# Altium schematic sheet 04_NAVIGATION.SchDoc
size A4; SheetNumber: 4; SheetTotal: 7
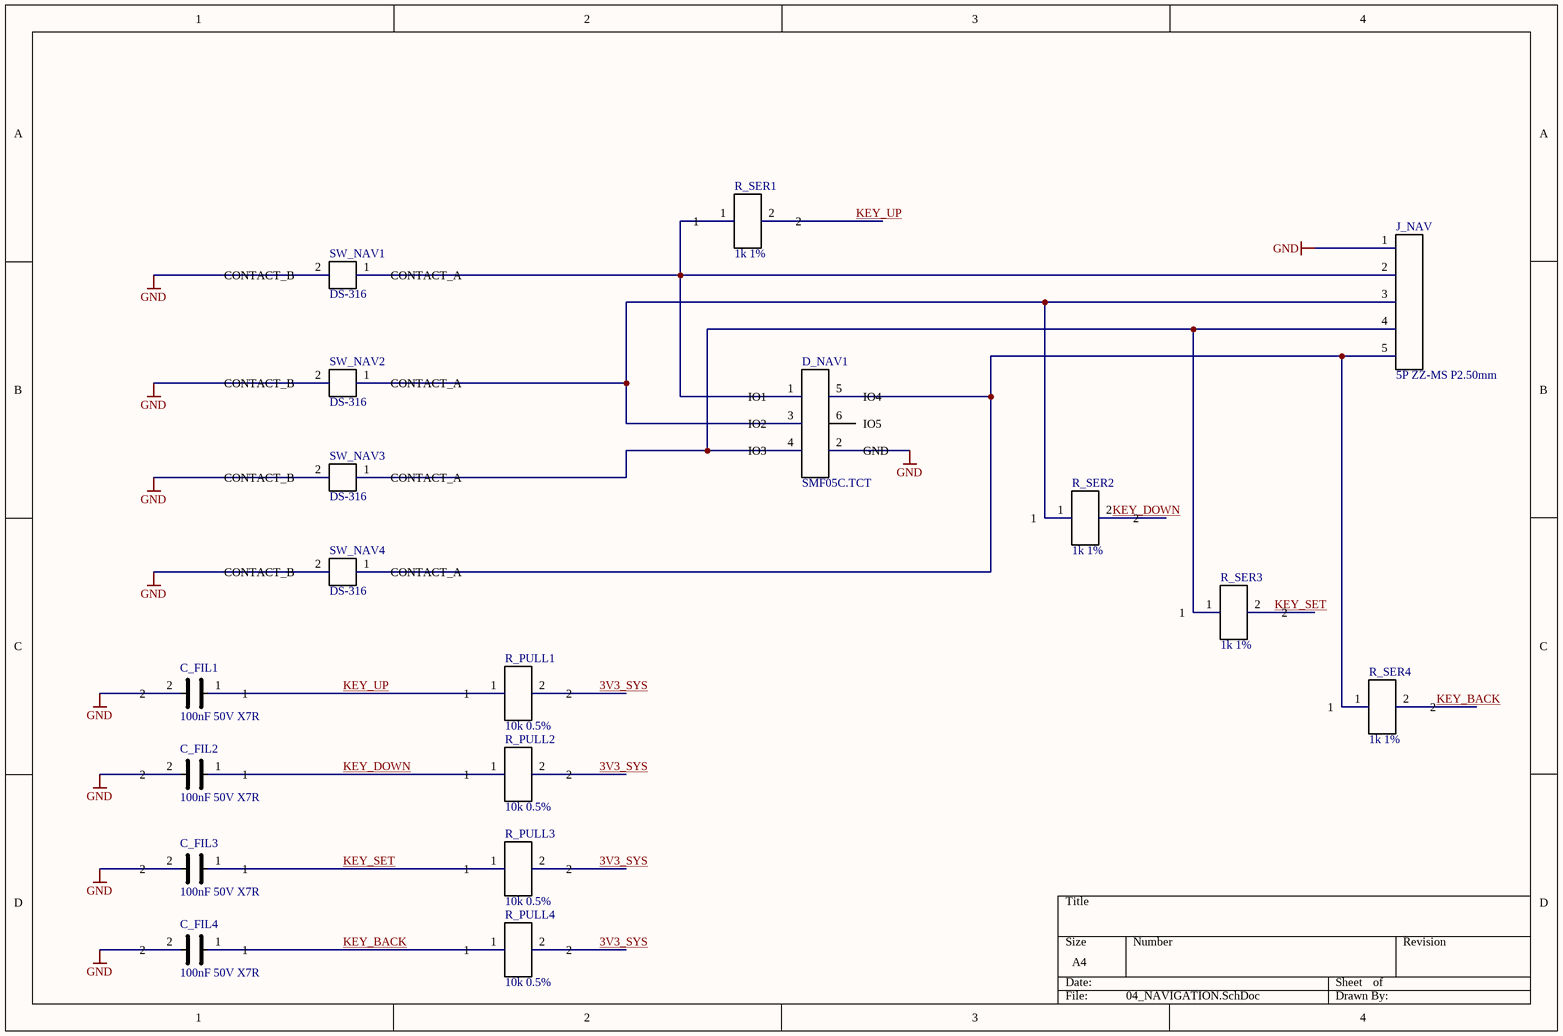
[diagram p0: 04_NAVIGATION.SchDoc]

## Parts
C_FIL1  100nF 50V X7R  [SAMSUNG_CL10_0603_CAP_2P]
C_FIL2  100nF 50V X7R  [SAMSUNG_CL10_0603_CAP_2P]
C_FIL3  100nF 50V X7R  [SAMSUNG_CL10_0603_CAP_2P]
C_FIL4  100nF 50V X7R  [SAMSUNG_CL10_0603_CAP_2P]
D_NAV1  SMF05C.TCT  [SEMTECH_SC70_6L_SMF05C]
J_NAV  5P ZZ-MS P2.50mm  [SHOUHAN_2P50_1X05_ZZMS_THT]
R_PULL1  10k 0.5%  [RES_0805_SHARED_2P]
R_PULL2  10k 0.5%  [RES_0805_SHARED_2P]
R_PULL3  10k 0.5%  [RES_0805_SHARED_2P]
R_PULL4  10k 0.5%  [RES_0805_SHARED_2P]
R_SER1  1k 1%  [RES_0805_SHARED_2P]
R_SER2  1k 1%  [RES_0805_SHARED_2P]
R_SER3  1k 1%  [RES_0805_SHARED_2P]
R_SER4  1k 1%  [RES_0805_SHARED_2P]
SW_NAV1  DS-316
SW_NAV2  DS-316
SW_NAV3  DS-316
SW_NAV4  DS-316

## Nets
GND: C_FIL1.2 C_FIL2.2 C_FIL3.2 C_FIL4.2 D_NAV1.2(GND) J_NAV.1 SW_NAV1.2(CONTACT_B) SW_NAV2.2(CONTACT_B) SW_NAV3.2(CONTACT_B) SW_NAV4.2(CONTACT_B)
3V3_SYS: R_PULL1.2 R_PULL2.2 R_PULL3.2 R_PULL4.2
KEY_BACK: C_FIL4.1 R_PULL4.1 R_SER4.2
KEY_DOWN: C_FIL2.1 R_PULL2.1 R_SER2.2
KEY_SET: C_FIL3.1 R_PULL3.1 R_SER3.2
KEY_UP: C_FIL1.1 R_PULL1.1 R_SER1.2
NetD_NAV1_1: D_NAV1.1(IO1) J_NAV.2 R_SER1.1 SW_NAV1.1(CONTACT_A)
NetD_NAV1_3: D_NAV1.3(IO2) J_NAV.3 R_SER2.1 SW_NAV2.1(CONTACT_A)
NetD_NAV1_4: D_NAV1.4(IO3) J_NAV.4 R_SER3.1 SW_NAV3.1(CONTACT_A)
NetD_NAV1_5: D_NAV1.5(IO4) J_NAV.5 R_SER4.1 SW_NAV4.1(CONTACT_A)

Not connected (* = marked no-connect by the designer): D_NAV1 6(IO5)

## Library data of the parts
C_FIL1-C_FIL4 = CL10B104KB8NNNC: MCU-core ceramic capacitor; Manufacturer: Samsung Electro-Mechanics; Source_Baseline: MCU_SCHEMATIC_ENTRY_BASELINE_v2.1_FA.txt; Design_Status: DESIGN_LOCK_MCU_CORE_V2.1_FOOTPRINT_HOLD; Qualification_Status: UNQUALIFIED_PENDING_SAVE_REOPEN_AUDIT; PIN_NUMBER_SOURCE: INTERNAL_CONVENTION; PIN_FUNCTION_SOURCE: MANUFACTURER_DATASHEET; MPN: CL10B104KB8NNNC; Value: 100nF 50V X7R; Package: 0603 / 1608 metric; Datasheet: https://product.samsungsem.com/mlcc/CL10B104KB8NNN.do
D_NAV1 = SMF05C.TCT: Five-line ESD protection array; Manufacturer: Semtech; Source_Baseline: POWER_SCHEMATIC_ENTRY_BASELINE_v0.17_FA.txt; Design_Status: CONTROLLED_V0.17; Qualification_Status: UNQUALIFIED_PENDING_SAVE_REOPEN_AUDIT; PIN_NUMBER_SOURCE: MANUFACTURER_DATASHEET; MPN: SMF05C.TCT; Value: SMF05C.TCT; Package: SC70-6; Datasheet: https://www.semtech.com/products/circuit-protection/esd-protection/smf05c; PIN_FUNCTION_SOURCE: MANUFACTURER_DATASHEET
J_NAV = 2.54mm-5P ZZ-MS: Five-position vertical THT Navigation connector; SHOUHAN drawing pitch 2.50 mm; Manufacturer: SHENZHEN SHOUHAN TECHNOLOGY CO., LTD; Source_Baseline: TASK17_NAVIGATION_ENTRY_BASELINE_v1.0_FA.txt; Design_Status: DESIGN_LOCK_NAV_V1.0_JNAV; Qualification_Status: UNQUALIFIED_PENDING_SAVE_REOPEN_AUDIT; PIN_NUMBER_SOURCE: PROJECT_INTERNAL_CONVENTION_LEFT_TO_RIGHT; PIN_FUNCTION_SOURCE: NAVIGATION_V1.0_PROJECT_CONNECTOR_MAPPING; MPN: 2.54mm-5P ZZ-MS; Value: 2.54mm-5P ZZ-MS; Package: 1x5 vertical THT; drawing pitch 2.50mm; Datasheet: SHOUHAN exact 2.54mm-5P ZZ-MS specification/drawing
R_PULL1-R_PULL4 = ARG05DTC1002: Precision power network resistor; Manufacturer: Viking Tech; Source_Baseline: POWER_SCHEMATIC_ENTRY_BASELINE_v0.17_FA.txt; Design_Status: DESIGN_LOCK_V0.17; Qualification_Status: UNQUALIFIED_PENDING_SAVE_REOPEN_AUDIT; PIN_NUMBER_SOURCE: INTERNAL_CONVENTION; PIN_FUNCTION_SOURCE: MANUFACTURER_DATASHEET; MPN: ARG05DTC1002; Value: 10k 0.5%; Package: 0805 / ARG05; Datasheet: Viking Tech AR series product data
R_SER1-R_SER4 = 0805W8F1001T5E: OVP series resistor; Manufacturer: UNI-ROYAL; Source_Baseline: POWER_SCHEMATIC_ENTRY_BASELINE_v0.17_FA.txt; Design_Status: CONTROLLED_V0.17_P9; Qualification_Status: UNQUALIFIED_PENDING_SAVE_REOPEN_AUDIT; PIN_NUMBER_SOURCE: INTERNAL_CONVENTION; PIN_FUNCTION_SOURCE: MANUFACTURER_DATASHEET; MPN: 0805W8F1001T5E; Value: 1k 1%; Package: 0805; Datasheet: UNI-ROYAL manufacturer resistor data
SW_NAV1-SW_NAV4 = DS-316: Panel SPST-NO momentary push button; off-board Navigation switch; Manufacturer: DAIER / controlled DS-316 family; Source_Baseline: TASK17_NAVIGATION_ENTRY_BASELINE_v1.0_FA.txt; Design_Status: DESIGN_LOCK_NAV_V1.0_OFFBOARD; Qualification_Status: UNQUALIFIED_PENDING_SAVE_REOPEN_AUDIT; PIN_NUMBER_SOURCE: PROJECT_INTERNAL_CONVENTION; PIN_FUNCTION_SOURCE: NAVIGATION_V1.0_SPST_NO; MPN: DS-316; Value: DS-316; Package: Panel mount; no PCB footprint; Datasheet: Controlled Navigation v1.0 / DS-316 family source